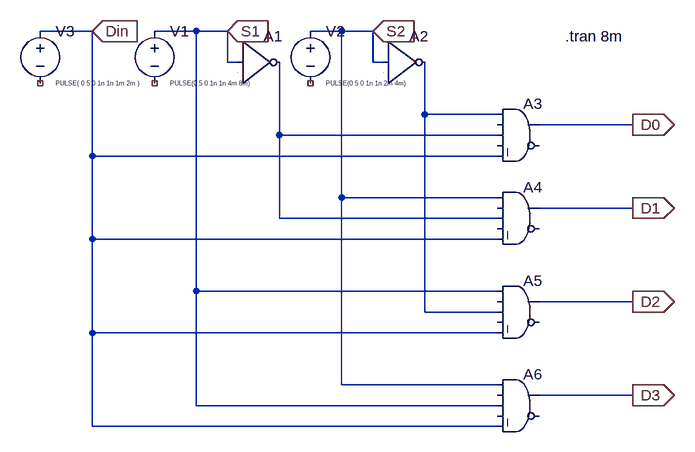
[diagram p0: schematic demux.asc]
demux.asc, the LTspice schematic file:
Version 4.1
SHEET 1 884 952
WIRE -96 224 -176 224
WIRE 64 224 0 224
WIRE 112 224 64 224
WIRE 288 224 240 224
WIRE 336 224 288 224
WIRE 112 272 112 224
WIRE 128 272 112 272
WIRE 336 272 336 224
WIRE 352 272 336 272
WIRE 416 352 416 272
WIRE 528 352 416 352
WIRE 736 368 592 368
WIRE 192 384 192 272
WIRE 528 384 192 384
WIRE -96 416 -96 224
WIRE 528 416 -96 416
WIRE 288 480 288 224
WIRE 528 480 288 480
WIRE 736 496 592 496
WIRE 192 512 192 384
WIRE 528 512 192 512
WIRE -96 544 -96 416
WIRE 528 544 -96 544
WIRE 64 624 64 224
WIRE 528 624 64 624
WIRE 736 640 592 640
WIRE 416 656 416 352
WIRE 528 656 416 656
WIRE -96 688 -96 544
WIRE 528 688 -96 688
WIRE 288 768 288 480
WIRE 528 768 288 768
WIRE 736 784 592 784
WIRE 64 800 64 624
WIRE 528 800 64 800
WIRE -96 832 -96 688
WIRE 528 832 -96 832
FLAG -96 224 Din
IOPIN -96 224 In
FLAG 112 224 S1
IOPIN 112 224 In
FLAG 336 224 S2
IOPIN 336 224 In
FLAG 736 368 D0
IOPIN 736 368 Out
FLAG 736 496 D1
IOPIN 736 496 Out
FLAG 736 640 D2
IOPIN 736 640 Out
FLAG 736 784 D3
IOPIN 736 784 Out
SYMBOL voltage 0 208 R0
WINDOW 3 24 96 Left 0
WINDOW 123 0 0 Left 0
WINDOW 39 0 0 Left 0
SYMATTR InstName V1
SYMATTR Value PULSE(0 5 0 1n 1n 4m 8m)
SYMBOL voltage 240 208 R0
WINDOW 3 24 96 Left 0
SYMATTR InstName V2
SYMATTR Value PULSE(0 5 0 1n 1n 2m 4m)
SYMBOL Digital\\inv 128 208 R0
SYMATTR InstName A1
SYMBOL Digital\\inv 352 208 R0
SYMATTR InstName A2
SYMBOL Digital\\and 560 320 R0
SYMATTR InstName A3
SYMBOL Digital\\and 560 448 R0
SYMATTR InstName A4
SYMBOL Digital\\and 560 592 R0
SYMATTR InstName A5
SYMBOL Digital\\and 560 736 R0
SYMATTR InstName A6
SYMBOL voltage -176 208 R0
WINDOW 3 24 96 Left 0
SYMATTR InstName V3
SYMATTR Value PULSE( 0 5 0 1n 1n 1m 2m )
TEXT 632 232 Left 2 !.tran 8m

The netlist it stands for:
* demux.asc
V1 S1 NC_01 PULSE(0 5 0 1n 1n 4m 8m)
V2 S2 NC_02 PULSE(0 5 0 1n 1n 2m 4m)
A1 S1 0 0 0 0 N002 0 0 BUF
A2 S2 0 0 0 0 N001 0 0 BUF
A3 N001 0 N002 0 Din 0 D0 0 AND
A4 S2 0 N002 0 Din 0 D1 0 AND
A5 S1 0 N001 0 Din 0 D2 0 AND
A6 S2 0 S1 0 Din 0 D3 0 AND
V3 Din NC_03 PULSE( 0 5 0 1n 1n 1m 2m )
.tran 8m
.backanno
.end